# Altium schematic sheet ESP_Sch.SchDoc
size A3; CompanyName: Tufts University; DrawnBy: Phuong Dao, Charlotte Wong; SheetNumber: 1; SheetTotal: 1; Time: BLUESCLUES PCB - JUNIOR DESIGN
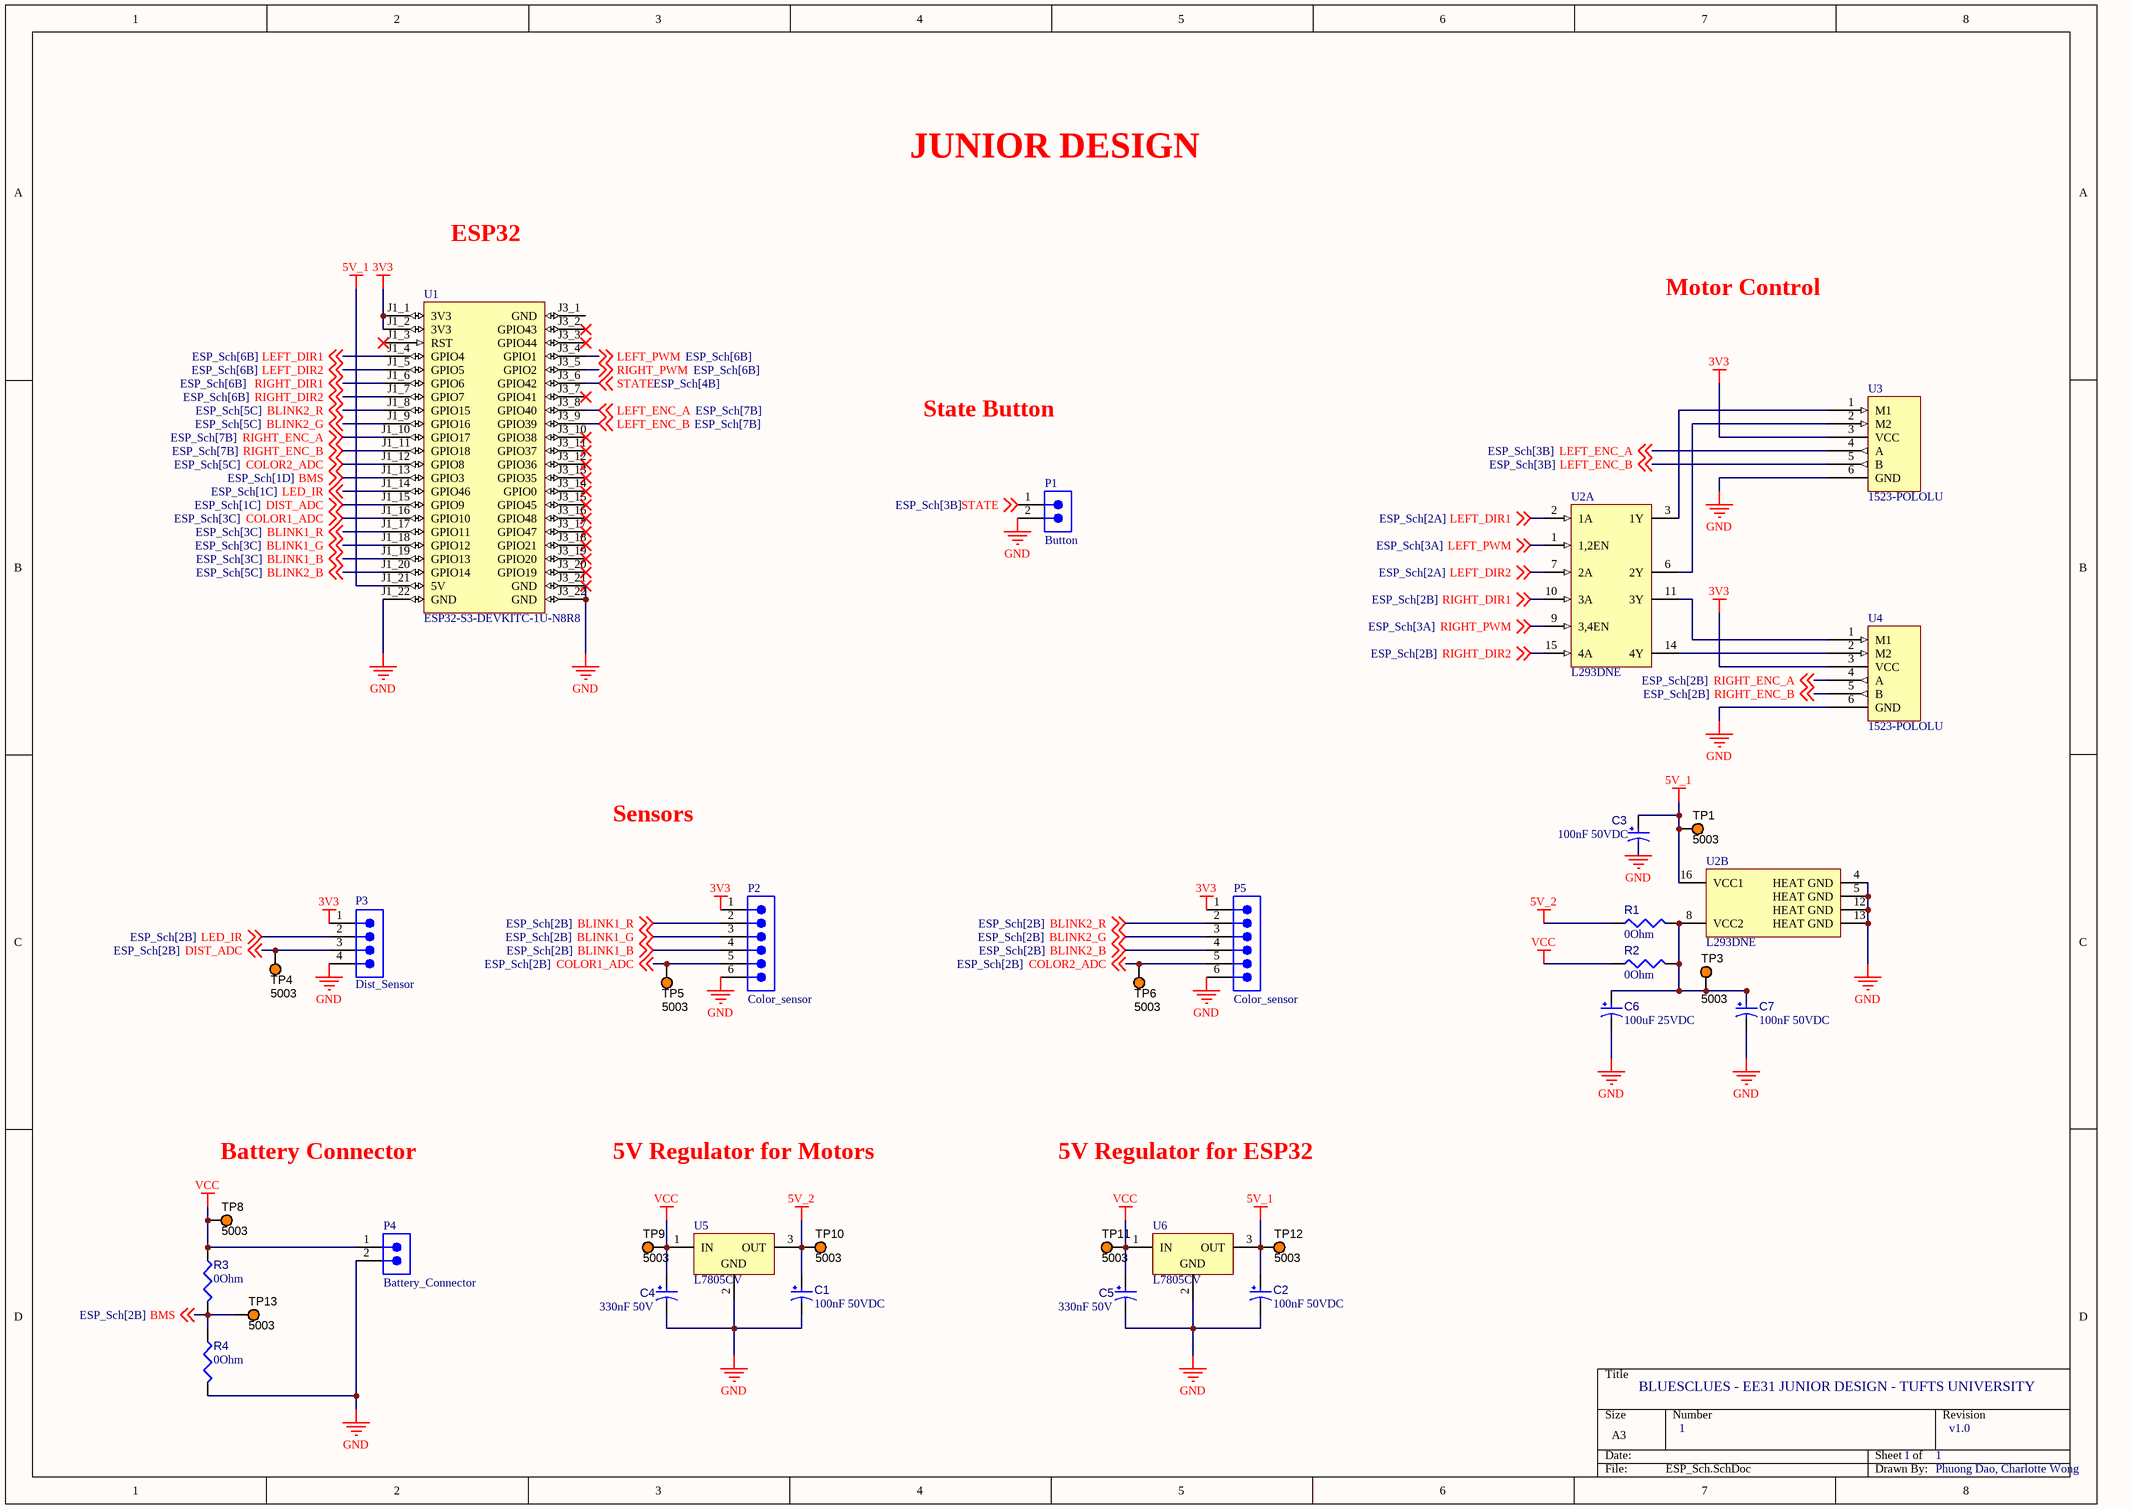
[diagram p0: ESP_Sch.SchDoc]

## Parts
C1  value 100nF 50VDC  [CAPPR55-250-1120X630X1220]  (hidden comment: 100uF 25VDC)
C2  value 100nF 50VDC  [CAPPR55-250-1120X630X1220]  (hidden comment: 100uF 25VDC)
C3  value 100nF 50VDC  [CAPPR55-250-1120X630X1220]  (hidden comment: 100uF 25VDC)
C4  330nF 50V  [CAPPR55-250-1120X630X1220]
C5  330nF 50V  [CAPPR55-250-1120X630X1220]
C6  100uF 25VDC  [CAPPR55-250-1120X630X1220]
C7  value 100nF 50VDC  [CAPPR55-250-1120X630X1220]  (hidden comment: 100uF 25VDC)
P1  Button  [61300211121]
P2  Color_sensor  [61300611121]
P3  Dist_Sensor  [61300411121]
P4  Battery_Connector  [61300211121]
P5  Color_sensor  [61300611121]
R1  value 0Ohm  [RESA60-630X240]  (hidden comment: MFR-25FBF52-22K1)
R2  value 0Ohm  [RESA60-630X240]  (hidden comment: MFR-25FBF52-22K1)
R3  value 0Ohm  [RESA60-630X240]  (hidden comment: MFR-25FBF52-22K1)
R4  value 0Ohm  [RESA60-630X240]  (hidden comment: MFR-25FBF52-22K1)
TP1  5003  [KSTN-5003]
TP3  5003  [KSTN-5003]
TP4  5003  [KSTN-5003]
TP5  5003  [KSTN-5003]
TP6  5003  [KSTN-5003]
TP8  5003  [KSTN-5003]
TP9  5003  [KSTN-5003]
TP10  5003  [KSTN-5003]
TP11  5003  [KSTN-5003]
TP12  5003  [KSTN-5003]
TP13  5003  [KSTN-5003]
U1  ESP32-S3-DEVKITC-1U-N8R8  [MODULE_ESP32-S3-DEVKITC-1U-N8R8]
U2  L293DNE  [NE0016A]  (parts A,B of 2)
U3  1523-POLOLU  [JST_B6B-XH-A]
U4  1523-POLOLU  [JST_B6B-XH-A]
U5  L7805CV  [TO220]
U6  L7805CV  [TO220]

## Nets
3V3: P2.1 P3.1 P5.1 U1.J1_1(3V3) U1.J1_2(3V3) U3.3(VCC) U4.3(VCC)
5V_1: C2.1 C3.1 TP1.1 TP12.1 U1.J1_21(5V) U2.16(VCC1) U6.3(OUT)
5V_2: C1.1 R1.1 TP10.1 U5.3(OUT)
GND: C1.2 C2.2 C3.2 C4.2 C5.2 C6.2 C7.2 P1.2 P2.6 P3.4 P4.2 P5.6 R4.2 U1.J1_22(GND) U1.J3_21(GND) U1.J3_22(GND) U2.4(HEAT_GND) U2.5(HEAT_GND) U2.12(HEAT_GND) U2.13(HEAT_GND) U3.6(GND) U4.6(GND) U5.2(GND) U6.2(GND)
VCC: C4.1 C5.1 P4.1 R2.1 R3.1 TP8.1 TP9.1 TP11.1 U5.1(IN) U6.1(IN)
BLINK1_B: P2.4 U1.J1_19(GPIO13) ; off-sheet BLINK1_B
BLINK1_G: P2.3 U1.J1_18(GPIO12) ; off-sheet BLINK1_G
BLINK1_R: P2.2 U1.J1_17(GPIO11) ; off-sheet BLINK1_R
BLINK2_B: P5.4 U1.J1_20(GPIO14) ; off-sheet BLINK2_B
BLINK2_G: P5.3 U1.J1_9(GPIO16) ; off-sheet BLINK2_G
BLINK2_R: P5.2 U1.J1_8(GPIO15) ; off-sheet BLINK2_R
BMS: R3.2 R4.1 TP13.1 U1.J1_13(GPIO3) ; off-sheet BMS
COLOR1_ADC: P2.5 TP5.1 U1.J1_16(GPIO10) ; off-sheet COLOR1_ADC
COLOR2_ADC: P5.5 TP6.1 U1.J1_12(GPIO8) ; off-sheet COLOR2_ADC
DIST_ADC: P3.3 TP4.1 U1.J1_15(GPIO9) ; off-sheet DIST_ADC
LED_IR: P3.2 U1.J1_14(GPIO46) ; off-sheet LED_IR
LEFT_DIR1: U1.J1_4(GPIO4) U2.2(1A) ; off-sheet LEFT_DIR1
LEFT_DIR2: U1.J1_5(GPIO5) U2.7(2A) ; off-sheet LEFT_DIR2
LEFT_ENC_A: U1.J3_8(GPIO40) U3.4(A) ; off-sheet LEFT_ENC_A
LEFT_ENC_B: U1.J3_9(GPIO39) U3.5(B) ; off-sheet LEFT_ENC_B
LEFT_PWM: U1.J3_4(GPIO1) U2.1(1,2EN) ; off-sheet LEFT_PWM
RIGHT_DIR1: U1.J1_6(GPIO6) U2.10(3A) ; off-sheet RIGHT_DIR1
RIGHT_DIR2: U1.J1_7(GPIO7) U2.15(4A) ; off-sheet RIGHT_DIR2
RIGHT_ENC_A: U1.J1_10(GPIO17) U4.4(A) ; off-sheet RIGHT_ENC_A
RIGHT_ENC_B: U1.J1_11(GPIO18) U4.5(B) ; off-sheet RIGHT_ENC_B
RIGHT_PWM: U1.J3_5(GPIO2) U2.9(3,4EN) ; off-sheet RIGHT_PWM
STATE: P1.1 U1.J3_6(GPIO42) ; off-sheet STATE
NetC6_1: C6.1 C7.1 R1.2 R2.2 TP3.1 U2.8(VCC2)
NetU2_3: U2.3(1Y) U3.1(M1)
NetU2_6: U2.6(2Y) U3.2(M2)
NetU2_11: U2.11(3Y) U4.1(M1)
NetU2_14: U2.14(4Y) U4.2(M2)

Not connected (* = marked no-connect by the designer): U1 J1_3(RST)* J3_1(GND) J3_2(GPIO43)* J3_3(GPIO44)* J3_7(GPIO41)* J3_10(GPIO38)* J3_11(GPIO37)* J3_12(GPIO36)* J3_13(GPIO35)* J3_14(GPIO0)* J3_15(GPIO45)* J3_16(GPIO48)* J3_17(GPIO47)* J3_18(GPIO21)* J3_19(GPIO20)* J3_20(GPIO19)*

## Notes on the sheet
- JUNIOR DESIGN
- ESP32
- Motor Control
- State Button
- Sensors
- Battery Connector
- 5V Regulator for Motors
- 5V Regulator for ESP32
- BLUESCLUES - EE31 JUNIOR DESIGN - TUFTS UNIVERSITY
- 1
- v1.0
- Phuong Dao, Charlotte Wong

## Library data of the parts
C1-C3 C6 C7 = CMP-001-00030-5: Aluminum Electrolytic Capacitor, 47 uF, +/- 20%, 50 V, -40 to 85 degC, 2-Pin THD, RoHS, Bulk; Manufacturer: Panasonic; Ripple Current: 130mA; Voltage Rating: 50V; Mounting Technology: TH; Min Operating Temperature: -40°C; Lead Pitch: 2.5mm; Manufacturer URL: http://www.panasonic.com/; RoHS Compliant: True; Packaging: Bulk; Datasheet Version: Rev. 05, 10/2016; Tolerance: 20%; Case/Package: Radial; Diameter: 6.3mm; Pins: 2; Ripple Current (AC): 130mA; Package Quantity: 200; Capacitor Type: Electrolytic; Package Description: 2-Pin Radial Lead, Dia 6.3 mm, Height 12.2 mm; Package Reference: CAPPR55-250-1120X630X1220; Max Operating Temperature: 85°C; Datasheet URL: https://industrial.panasonic.com/cdbs/www-data/pdf/RDF0000/ABA0000C1218.pdf
  C6: Value: 100uF 25VDC
C4 C5 = CMP-001-00030-5: Aluminum Electrolytic Capacitor, 47 uF, +/- 20%, 50 V, -40 to 85 degC, 2-Pin THD, RoHS, Bulk; Manufacturer: Panasonic; Ripple Current: 130mA; Mounting Technology: TH; Min Operating Temperature: -40°C; Lead Pitch: 2.5mm; Manufacturer URL: http://www.panasonic.com/; RoHS Compliant: True; Packaging: Bulk; Datasheet Version: Rev. 05, 10/2016; Tolerance: 20%; Case/Package: Radial; Diameter: 6.3mm; Pins: 2; Ripple Current (AC): 130mA; Package Quantity: 200; Capacitor Type: Electrolytic; Value: 330nF 50V; Voltage Rating: 50V; Package Description: 2-Pin Radial Lead, Dia 6.3 mm, Height 12.2 mm; Package Reference: CAPPR55-250-1120X630X1220; Max Operating Temperature: 85°C; Datasheet URL: https://industrial.panasonic.com/cdbs/www-data/pdf/RDF0000/ABA0000C1218.pdf
P1 P4 = CMP-1712-00002-7: THT Vertical Pin Header WR-PHD, Pitch 2.54 mm, Single Row, 2 pins; Pitch: 2.54mm; Number of Contacts: 2; Connector Type: Male Pin; Gender: Male; Contact Resistance: 20mΩ; Operating Supply Voltage: 250V; Current Rating: 3A; Housing Material: PBT; RoHS: Compliant; Lead Free: Lead Free; Contact Material: Gold; REACH SVHC: No; Min Operating Temperature: -40°C; Termination: Through Hole; Number of Pins: 2; Contact Gender: Male; Packaging: Bulk; Lead Pitch: 2.54mm; Contact Plating: Gold; Orientation: Vertical; Mount: Through Hole; Height: 8.94mm; Color: Black; Number of Positions: 2; Contact Mating Length: 5.9944mm; Max Operating Temperature: 105°C; Voltage Rating: 250V; Number of Rows: 1
P2 P5 = CMP-1502-01070-4: THT Vertical Pin Header WR-PHD, Pitch 2.54 mm, Single Row, 6 pins; Pitch: 2.54mm; Operating Supply Voltage: 250V; Connector Type: Male Pin; Gender: Male; Number of Positions: 6; Contact Resistance: 20mΩ; Current Rating: 3A; Termination: Through Hole; Color: Black; Number of Pins: 6; Lead Pitch: 2.54mm; Height: 8.89mm; RoHS: Compliant; Lead Free: Lead Free; Contact Mating Length: 5.9944mm; Contact Plating: Gold; Contact Gender: Male; Packaging: Bulk; Orientation: Vertical; Mount: Through Hole; Voltage Rating: 250V; Number of Rows: 1; Max Operating Temperature: 105°C; Min Operating Temperature: -40°C; Housing Material: PBT; Contact Material: Gold; Number of Contacts: 6
P3 = CMP-002-00088-1: CONN HEADER VERT 4POS 2.54MM; Manufacturer: Würth Elektronik; NexarPartId: 32855522; Current Rating: 3A; NexarCadSource: Wurth Elektronik; ContentHash: 0220F8311916AC9FAC57190B782E2ACB; Operating Supply Voltage: 250V; Connector Type: Male Pin; Number of Positions: 4; Contact Resistance: 20mΩ; Gender: Male; NexarCadSourceId: 3913; Mounting Technology: Through Hole; REACH SVHC: Unknown; Pins: 4; Design Item ID: 61300411121; Mount: Through Hole; Pitch: 2.54mm; Orientation: Vertical; Max Operating Temperature: 105°C; Part Number: 61300411121; Source: FIR_Board_DS.SCHLIB; Min Operating Temperature: -40°C; Lead Free: Lead Free; Contact Plating: Gold; Packaging: Bulk; Voltage Rating: 250V; Contact Mating Length: 5.9944mm; Color: Black; RoHS: Compliant; Number of Contacts: 4; Number of Rows: 1; Contact Material: Copper; Lead Pitch: 2.54mm; Termination: Solder; Case/Package: Through Hole; Height: 8.89mm
R1-R4 = CMP-009-00052-3: Axial Resistor, 22.1 KOhm, +/- 1%, 0.25 W, -55 to 155 degC, 2-Pin THD, RoHS, Bulk; Manufacturer: Yageo; Power: 250mW; Voltage Rating: 250V; Tolerance: 1%; Package Description: 2-Pin Axial Lead, Dia 2.4 mm, Body Length 6.3 mm; RoHS Compliant: True; Min Operating Temperature: -55°C; Datasheet URL: http://www.yageo.com/documents/recent/Yageo%20LR_MFR_2013.pdf; Packaging: Bulk; Datasheet Version: Apr-13; Package Reference: MFR-25; Package Quantity: 200; Manufacturer URL: http://www.yageo.com/; Mounting Technology: TH; Case/Package: Axial; Max Operating Temperature: 155°C
TP1 TP3-TP6 TP8-TP13 = CMP-002-00037-1: Test Point, Orange, Height 4.6 mm, Tail Length 3 mm, 1-Pin THD, RoHS; Manufacturer: Keystone; Package Description: 1-Pin Through Hole Device, Dia 2.54 mm; Package Quantity: 10; Case/Package: 5003; RoHS Compliant: True; Packaging: Bulk; Pins: 1; Diameter: 2.54mm; Connector Type: TestPoint; Manufacturer URL: http://www.keyelco.com/; Colour: Orange; Package Reference: 5003; Datasheet Version: Jun-15; Contact Material: Bronze; Mounting Technology: TH; Contact Plating: Tin; Datasheet URL: http://keyelco.com/userAssets/file/M65p56.pdf
U1 = ESP32-S3-DEVKITC-1U-N8R8: The ESP32-S3-DEVKITC-1U-N8R8 from Espressif Systems is an evaluation board designed for wireless communication applications. It features a 32-bit Xtensa dual-core processor running at 240MHz, providing strong processing power for complex tasks. The board; SnapEDA_Link: https://www.snapeda.com/parts/ESP32-S3-DEVKITC-1U-N8R8/Espressif+Systems/view-part/?ref=snap; Package: None; Value: *; MF: Espressif Systems; MP: ESP32-S3-DEVKITC-1U-N8R8; Check_prices: https://www.snapeda.com/parts/ESP32-S3-DEVKITC-1U-N8R8/Espressif+Systems/view-part/?ref=eda
U2 = CMP-019-00017-2: Quadruple Half-H Driver, 1.2 A Peak, 4.5 to 36 V, 0 to 70 degC, 16-Pin DIP (NE), Pb-Free (RoHS), Tube; Manufacturer: Texas Instruments; Output Voltage: 36V; Interface: Parallel; Min Supply Voltage: 4.5V; Outputs: 4; Package Version: 4040054/B, 04/1995; Output Current: 600mA; Max Operating Temperature: 70°C; Mounting Technology: TH; Packaging: Rail/Tube; Max Supply Voltage: 36V; Package URL: http://www.ti.com/lit/ml/mpdi003/mpdi003.pdf; Package Quantity: 25; Min Operating Temperature: 0°C; RoHS Compliant: True; Package Description: 16-Pin Through Hole Device, Body 19.8 x 6.35 mm, Pitch 2.54 mm, Row Spacing 7.62 mm; Manufacturer URL: http://www.ti.com/; Package Reference: NE0016A; Pins: 16; Datasheet Version: SLRS008D, 01/2016; Datasheet URL: http://www.ti.com/general/docs/lit/getliterature.tsp?genericPartNumber=l293d&fileType=pdf; Case/Package: DIP
U3 U4 = CMP-00028-00007-3: Magnetic Encoder Pair Kit for Mini Plastic Gearmotors, 12 CPR, 2.7-18V
U5 U6 = CMP-0244-00483-1: Positive Voltage Regulator, 5V, 3-Pin TO-220; PackageDescription: TO, Thru-Hole, Vertical, Heatsink Mounted; 3 In-Line Leads; Pitch 2.54 mm; ComponentLink2Description: Datasheet; PackageReference: TO220; ComponentLink3URL: http://www.st.com/internet/com/TECHNICAL_RESOURCES/TECHNICAL_LITERATURE/PACKAGE_INFORMATION/CD00004649.pdf; DatasheetVersion: 16/11/2011; ComponentLink1Description: Manufacturer URL; ComponentLink1URL: http://www.st.com; PackageVersion: ver3.0; ComponentLink3Description: Package Specification; ComponentLink2URL: http://www.st.com/internet/com/TECHNICAL_RESOURCES/TECHNICAL_LITERATURE/DATASHEET/CD00000444.pdf